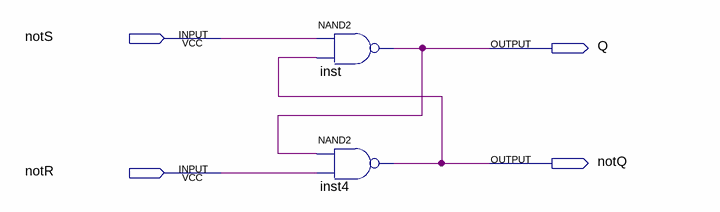
[diagram p0: schematic sheet]
// Quartus schematic Debouce.bdf as structural Verilog: 2 symbols, 4 pins
module Debouce (
  input  notS,
  input  notR,
  output Q,
  output notQ
);

  nand inst (Q, notS, notQ);
  nand inst4 (notQ, Q, notR);
endmodule
